# Altium schematic sheet Dahili Moduller 2.SchDoc
size A4; SheetNumber: 6; SheetTotal: 7
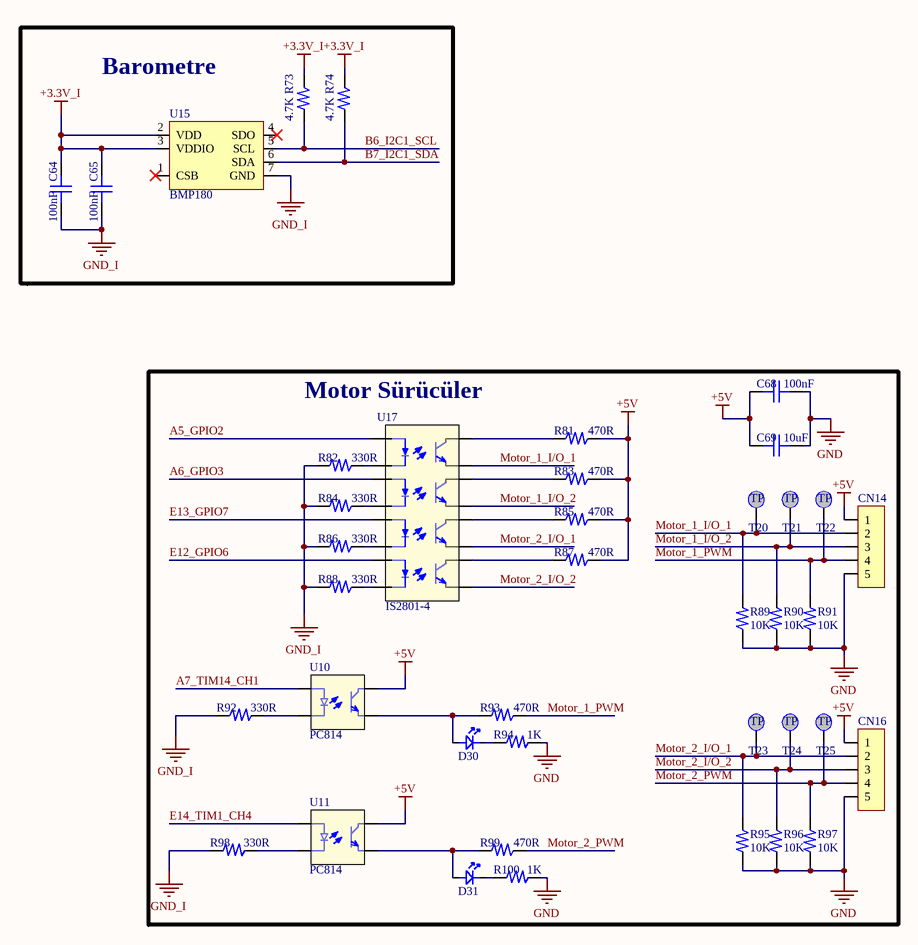
[diagram p0: Dahili Moduller 2.SchDoc]

## Parts
C64  100nF  [0805 Kapasıtor]
C65  100nF  [0805 Kapasıtor]
C68  100nF  [0805 Kapasıtor]
C69  10uF  [0805 Kapasıtor]
CN14  5_Pin_JST_Male  [5_Pin_JST_Male]  (value not drawn)
CN16  5_Pin_JST_Male  [5_Pin_JST_Male]  (value not drawn)
D30  0805 LED  [0805 LED]  (value not drawn)
D31  0805 LED  [0805 LED]  (value not drawn)
R73  4.7K  [0805 Dırenc]
R74  4.7K  [0805 Dırenc]
R81  470R  [0805 Dırenc]
R82  330R  [0805 Dırenc]
R83  470R  [0805 Dırenc]
R84  330R  [0805 Dırenc]
R85  470R  [0805 Dırenc]
R86  330R  [0805 Dırenc]
R87  470R  [0805 Dırenc]
R88  330R  [0805 Dırenc]
R89  10K  [0805 Dırenc]
R90  10K  [0805 Dırenc]
R91  10K  [0805 Dırenc]
R92  330R  [0805 Dırenc]
R93  470R  [0805 Dırenc]
R94  1K  [0805 Dırenc]
R95  10K  [0805 Dırenc]
R96  10K  [0805 Dırenc]
R97  10K  [0805 Dırenc]
R98  330R  [0805 Dırenc]
R99  470R  [0805 Dırenc]
R100  1K  [0805 Dırenc]
T20  Test Noktası  [Test Noktası]  (value not drawn)
T21  Test Noktası  [Test Noktası]  (value not drawn)
T22  Test Noktası  [Test Noktası]  (value not drawn)
T23  Test Noktası  [Test Noktası]  (value not drawn)
T24  Test Noktası  [Test Noktası]  (value not drawn)
T25  Test Noktası  [Test Noktası]  (value not drawn)
U10  PC814  [SOIC4]
U11  PC814  [SOIC4]
U15  BMP180  [BMP180]
U17  IS2801-4  [IS2801-4_ISO]

## Blocks framed on the sheet
Barometre: C64 C65 R73 R74 U15
Motor Sürücüler: C68 C69 CN14 CN16 D30 D31 R81-R100 T20-T25 U10 U11 U17

## Nets
+3.3V_I: C64.2 C65.2 R73.2 R74.2 U15.2(VDD) U15.3(VDDIO)
+5V: C68.2 C69.2 CN14.1 CN16.1 R81.2 R83.2 R85.2 R87.2 U10.4 U11.4
GND: C68.1 C69.1 CN14.5 CN16.5 R89.1 R90.1 R91.1 R94.2 R95.1 R96.1 R97.1 R100.2
GND_I: C64.1 C65.1 R82.1 R84.1 R86.1 R88.1 R92.1 R98.1 U15.7(GND)
A5_GPIO2: U17.1
A6_GPIO3: U17.3
A7_TIM14_CH1: U10.1
B6_I2C1_SCL: R73.1 U15.5(SCL)
B7_I2C1_SDA: R74.1 U15.6(SDA)
E12_GPIO6: U17.7
E13_GPIO7: U17.5
E14_TIM1_CH4: U11.1
Motor_1_I/O_1: CN14.2 R89.2 T20.1 U17.15
Motor_1_I/O_2: CN14.3 R90.2 T21.1 U17.13
Motor_1_PWM: CN14.4 R91.2 R93.2 T22.1
Motor_2_I/O_1: CN16.2 R95.2 T23.1 U17.11
Motor_2_I/O_2: CN16.3 R96.2 T24.1 U17.9
Motor_2_PWM: CN16.4 R97.2 R99.2 T25.1
NetD30_1: D30.1 R93.1 U10.3
NetD30_2: D30.2 R94.1
NetD31_1: D31.1 R99.1 U11.3
NetD31_2: D31.2 R100.1
NetR81_1: R81.1 U17.16
NetR82_2: R82.2 U17.2
NetR83_1: R83.1 U17.14
NetR84_2: R84.2 U17.4
NetR85_1: R85.1 U17.12
NetR86_2: R86.2 U17.6
NetR87_1: R87.1 U17.10
NetR88_2: R88.2 U17.8
NetR92_2: R92.2 U10.2
NetR98_2: R98.2 U11.2

Not connected (* = marked no-connect by the designer): U15 1(CSB)* 4(SDO)*

## Notes on the sheet
- (in symbol Test Noktası) TP

## Library data of the parts
C64 C65 C68 C69 = Kapasitor 0805
R73 R74 R81-R100 = Direnc 0805
U10 U11 = PC814: Description; Manufacturer_Name: Isocom; Manufacturer_Part_Number: IS2801-1; Type: Optoisolators; Copyright: Copyright (C) 2026 Ultra Librarian. All rights reserved.; RefDes: RefDes
U17 = IS2801-4: Description; Manufacturer_Name: Isocom; Copyright: Copyright (C) 2025 Ultra Librarian. All rights reserved.; Manufacturer_Part_Number: IS2801-4; RefDes: RefDes; Type: Type